# Altium schematic sheet CW341_FPGAIO_5.SchDoc: Kintex IO Banks
size Letter; Organization: NewAE Technology Inc.; Address1: 1083 Queen St., Suite 196; Address2: Halifax; Address3: NS; Address4: Canada B3H 0B2; SheetNumber: 10; SheetTotal: 16; SheetApproved: YES
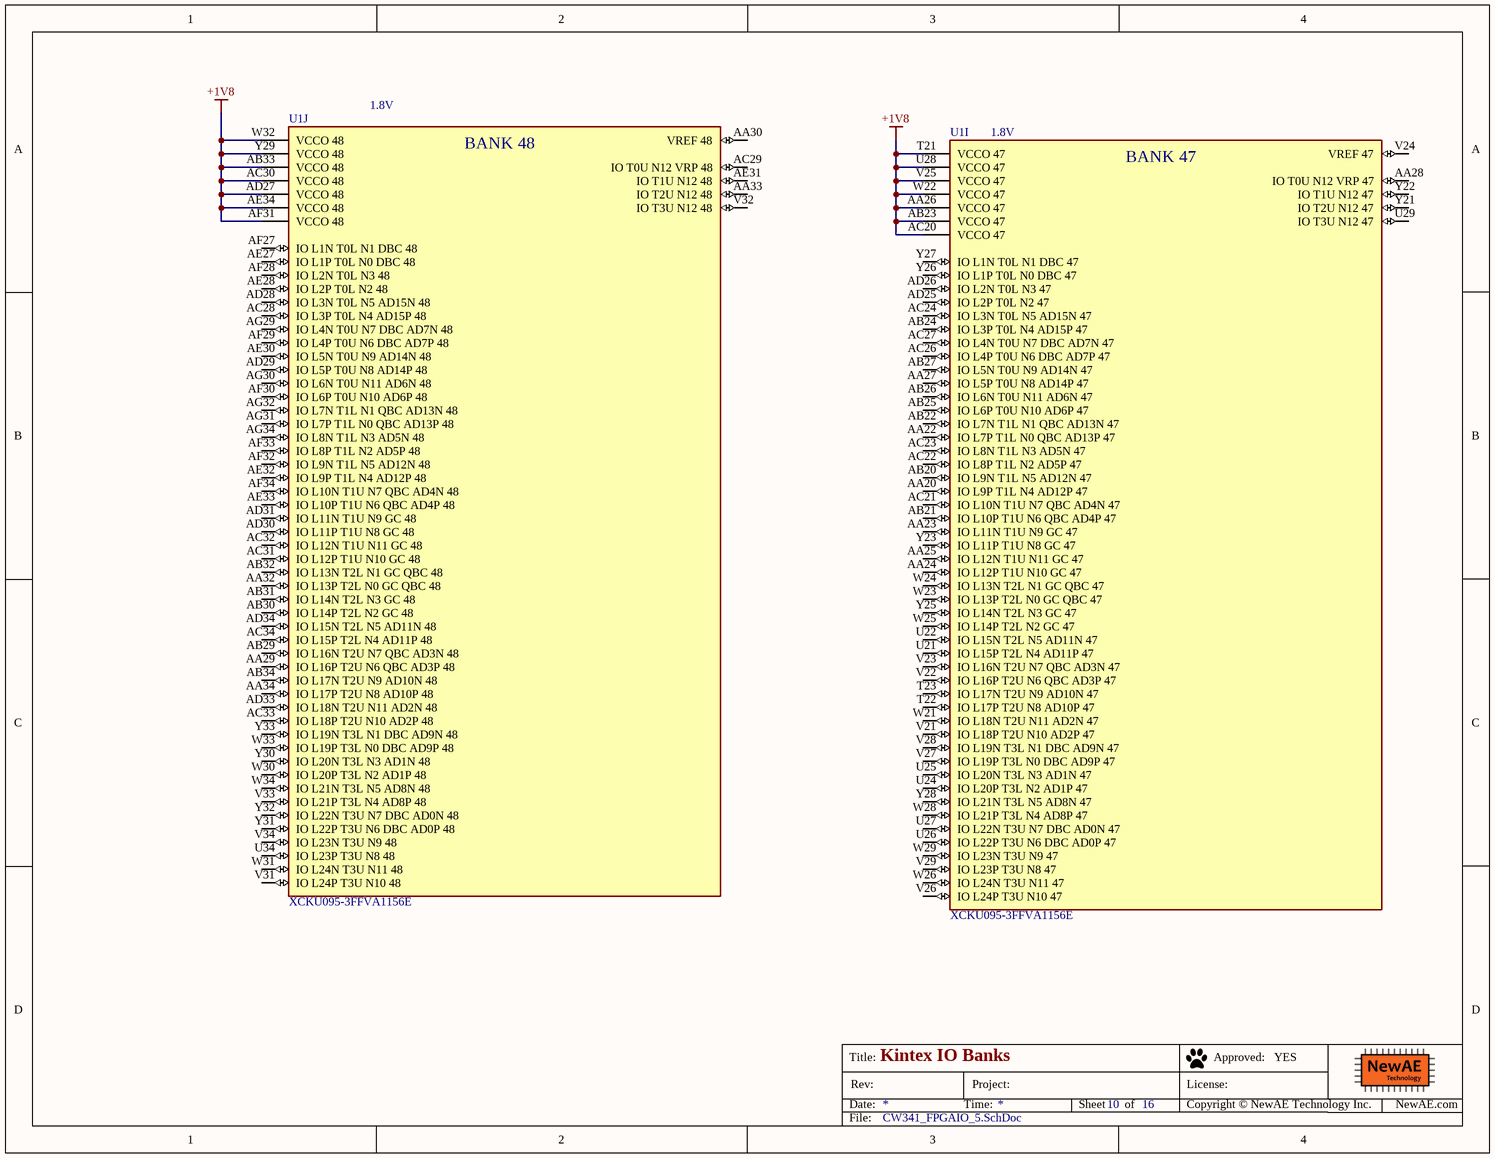
[diagram p0: CW341_FPGAIO_5.SchDoc]

## Parts
U1  XCKU095-3FFVA1156E  [FP-XCKU060-3FFVA1156E-MFG]  (parts I,J of 23)

## Nets
+1V8: U1.AA26(VCCO_47) U1.AB23(VCCO_47) U1.AB33(VCCO_48) U1.AC20(VCCO_47) U1.AC30(VCCO_48) U1.AD27(VCCO_48) U1.AE34(VCCO_48) U1.AF31(VCCO_48) U1.T21(VCCO_47) U1.U28(VCCO_47) U1.V25(VCCO_47) U1.W22(VCCO_47) U1.W32(VCCO_48) U1.Y29(VCCO_48)

Not connected (* = marked no-connect by the designer): U1 AA20(IO_L9P_T1L_N4_AD12P_47) AA22(IO_L7P_T1L_N0_QBC_AD13P_47) AA23(IO_L11N_T1U_N9_GC_47) AA24(IO_L12P_T1U_N10_GC_47) AA25(IO_L12N_T1U_N11_GC_47) AA27(IO_L5P_T0U_N8_AD14P_47) AA28(IO_T0U_N12_VRP_47) AA29(IO_L16P_T2U_N6_QBC_AD3P_48) AA30(VREF_48) AA32(IO_L13P_T2L_N0_GC_QBC_48) AA33(IO_T2U_N12_48) AA34(IO_L17P_T2U_N8_AD10P_48) AB20(IO_L9N_T1L_N5_AD12N_47) AB21(IO_L10P_T1U_N6_QBC_AD4P_47) AB22(IO_L7N_T1L_N1_QBC_AD13N_47) AB24(IO_L3P_T0L_N4_AD15P_47) AB25(IO_L6P_T0U_N10_AD6P_47) AB26(IO_L6N_T0U_N11_AD6N_47) AB27(IO_L5N_T0U_N9_AD14N_47) AB29(IO_L16N_T2U_N7_QBC_AD3N_48) AB30(IO_L14P_T2L_N2_GC_48) AB31(IO_L14N_T2L_N3_GC_48) AB32(IO_L13N_T2L_N1_GC_QBC_48) AB34(IO_L17N_T2U_N9_AD10N_48) AC21(IO_L10N_T1U_N7_QBC_AD4N_47) AC22(IO_L8P_T1L_N2_AD5P_47) AC23(IO_L8N_T1L_N3_AD5N_47) AC24(IO_L3N_T0L_N5_AD15N_47) AC26(IO_L4P_T0U_N6_DBC_AD7P_47) AC27(IO_L4N_T0U_N7_DBC_AD7N_47) AC28(IO_L3P_T0L_N4_AD15P_48) AC29(IO_T0U_N12_VRP_48) AC31(IO_L12P_T1U_N10_GC_48) AC32(IO_L12N_T1U_N11_GC_48) AC33(IO_L18P_T2U_N10_AD2P_48) AC34(IO_L15P_T2L_N4_AD11P_48) AD25(IO_L2P_T0L_N2_47) AD26(IO_L2N_T0L_N3_47) AD28(IO_L3N_T0L_N5_AD15N_48) AD29(IO_L5P_T0U_N8_AD14P_48) AD30(IO_L11P_T1U_N8_GC_48) AD31(IO_L11N_T1U_N9_GC_48) AD33(IO_L18N_T2U_N11_AD2N_48) AD34(IO_L15N_T2L_N5_AD11N_48) AE27(IO_L1P_T0L_N0_DBC_48) AE28(IO_L2P_T0L_N2_48) AE30(IO_L5N_T0U_N9_AD14N_48) AE31(IO_T1U_N12_48) AE32(IO_L9P_T1L_N4_AD12P_48) AE33(IO_L10P_T1U_N6_QBC_AD4P_48) AF27(IO_L1N_T0L_N1_DBC_48) AF28(IO_L2N_T0L_N3_48) AF29(IO_L4P_T0U_N6_DBC_AD7P_48) AF30(IO_L6P_T0U_N10_AD6P_48) AF32(IO_L9N_T1L_N5_AD12N_48) AF33(IO_L8P_T1L_N2_AD5P_48) AF34(IO_L10N_T1U_N7_QBC_AD4N_48) AG29(IO_L4N_T0U_N7_DBC_AD7N_48) AG30(IO_L6N_T0U_N11_AD6N_48) AG31(IO_L7P_T1L_N0_QBC_AD13P_48) AG32(IO_L7N_T1L_N1_QBC_AD13N_48) AG34(IO_L8N_T1L_N3_AD5N_48) T22(IO_L17P_T2U_N8_AD10P_47) T23(IO_L17N_T2U_N9_AD10N_47) U21(IO_L15P_T2L_N4_AD11P_47) U22(IO_L15N_T2L_N5_AD11N_47) U24(IO_L20P_T3L_N2_AD1P_47) U25(IO_L20N_T3L_N3_AD1N_47) U26(IO_L22P_T3U_N6_DBC_AD0P_47) U27(IO_L22N_T3U_N7_DBC_AD0N_47) U29(IO_T3U_N12_47) U34(IO_L23P_T3U_N8_48) V21(IO_L18P_T2U_N10_AD2P_47) V22(IO_L16P_T2U_N6_QBC_AD3P_47) V23(IO_L16N_T2U_N7_QBC_AD3N_47) V24(VREF_47) V26(IO_L24P_T3U_N10_47) V27(IO_L19P_T3L_N0_DBC_AD9P_47) V28(IO_L19N_T3L_N1_DBC_AD9N_47) V29(IO_L23P_T3U_N8_47) V31(IO_L24P_T3U_N10_48) V32(IO_T3U_N12_48) V33(IO_L21P_T3L_N4_AD8P_48) V34(IO_L23N_T3U_N9_48) W21(IO_L18N_T2U_N11_AD2N_47) W23(IO_L13P_T2L_N0_GC_QBC_47) W24(IO_L13N_T2L_N1_GC_QBC_47) W25(IO_L14P_T2L_N2_GC_47) W26(IO_L24N_T3U_N11_47) W28(IO_L21P_T3L_N4_AD8P_47) W29(IO_L23N_T3U_N9_47) W30(IO_L20P_T3L_N2_AD1P_48) W31(IO_L24N_T3U_N11_48) W33(IO_L19P_T3L_N0_DBC_AD9P_48) W34(IO_L21N_T3L_N5_AD8N_48) Y21(IO_T2U_N12_47) Y22(IO_T1U_N12_47) Y23(IO_L11P_T1U_N8_GC_47) Y25(IO_L14N_T2L_N3_GC_47) Y26(IO_L1P_T0L_N0_DBC_47) Y27(IO_L1N_T0L_N1_DBC_47) Y28(IO_L21N_T3L_N5_AD8N_47) Y30(IO_L20N_T3L_N3_AD1N_48) Y31(IO_L22P_T3U_N6_DBC_AD0P_48) Y32(IO_L22N_T3U_N7_DBC_AD0N_48) Y33(IO_L19N_T3L_N1_DBC_AD9N_48)

## Notes on the sheet
- (near U1) 1.8V
- Title:
- Date:
- Rev:
- Time:
- Project:
- Sheet
- of
- License:
- Copyright © NewAE Technology Inc.
- Approved:
- NewAE.com
- File:
- (in symbol IC-XCKU095-1156, part I) BANK 47
- (in symbol IC-XCKU095-1156, part J) BANK 48

## Library data of the parts
U1 = IC-XCKU095-1156: IC FPGA 520 I/O 1156FCBGA; Manufacturer: Xilinx; Manufacturer Part Number: XCKU060-3FFVA1156E; Standoff Height: 0.4mm; Ram Size: 38MBytes; Min Supply Voltage: 0.97V; Max Junction Temp: +100°C; Max Supply Voltage: 1.8V; Number Of Logic Elements Cells: 1176000; Number Of I/Os: 520; Speed Grade: 3; Memory Type: RAM; Ipc Land Pattern Name: BGA1156N100P34X34_3500X3500X342; RoHS: TRUE; Height: 3.51mm; Footprint Url: https://www.xilinx.com/support/documentation/user_guides/ug575-ultrascale-pkg-pinout.pdf; Device Class L2: Embedded Processors and Controllers; ComponentLink2URL: https://www.xilinx.com/support/documentation/data_sheets/ds890-ultrascale-overview.pdf; Temperature Range High: +100°C; Device Class L1: Integrated Circuits (ICs); Package: 0; Octopart: https://octopart.com/xcku035-3ffva1156e-xilinx-67038192?r=sp; Automotive: No; ComponentLink2Description: Datasheet; Device Class L3: FPGAs - Field Programmable Gate Arrays; Category: IC; Lead Free: Yes; Temperature: 0°C to +100°C; Temperature Range Low: 0°C; Digikey Description: IC FPGA 520 I/O 1156FCBGA